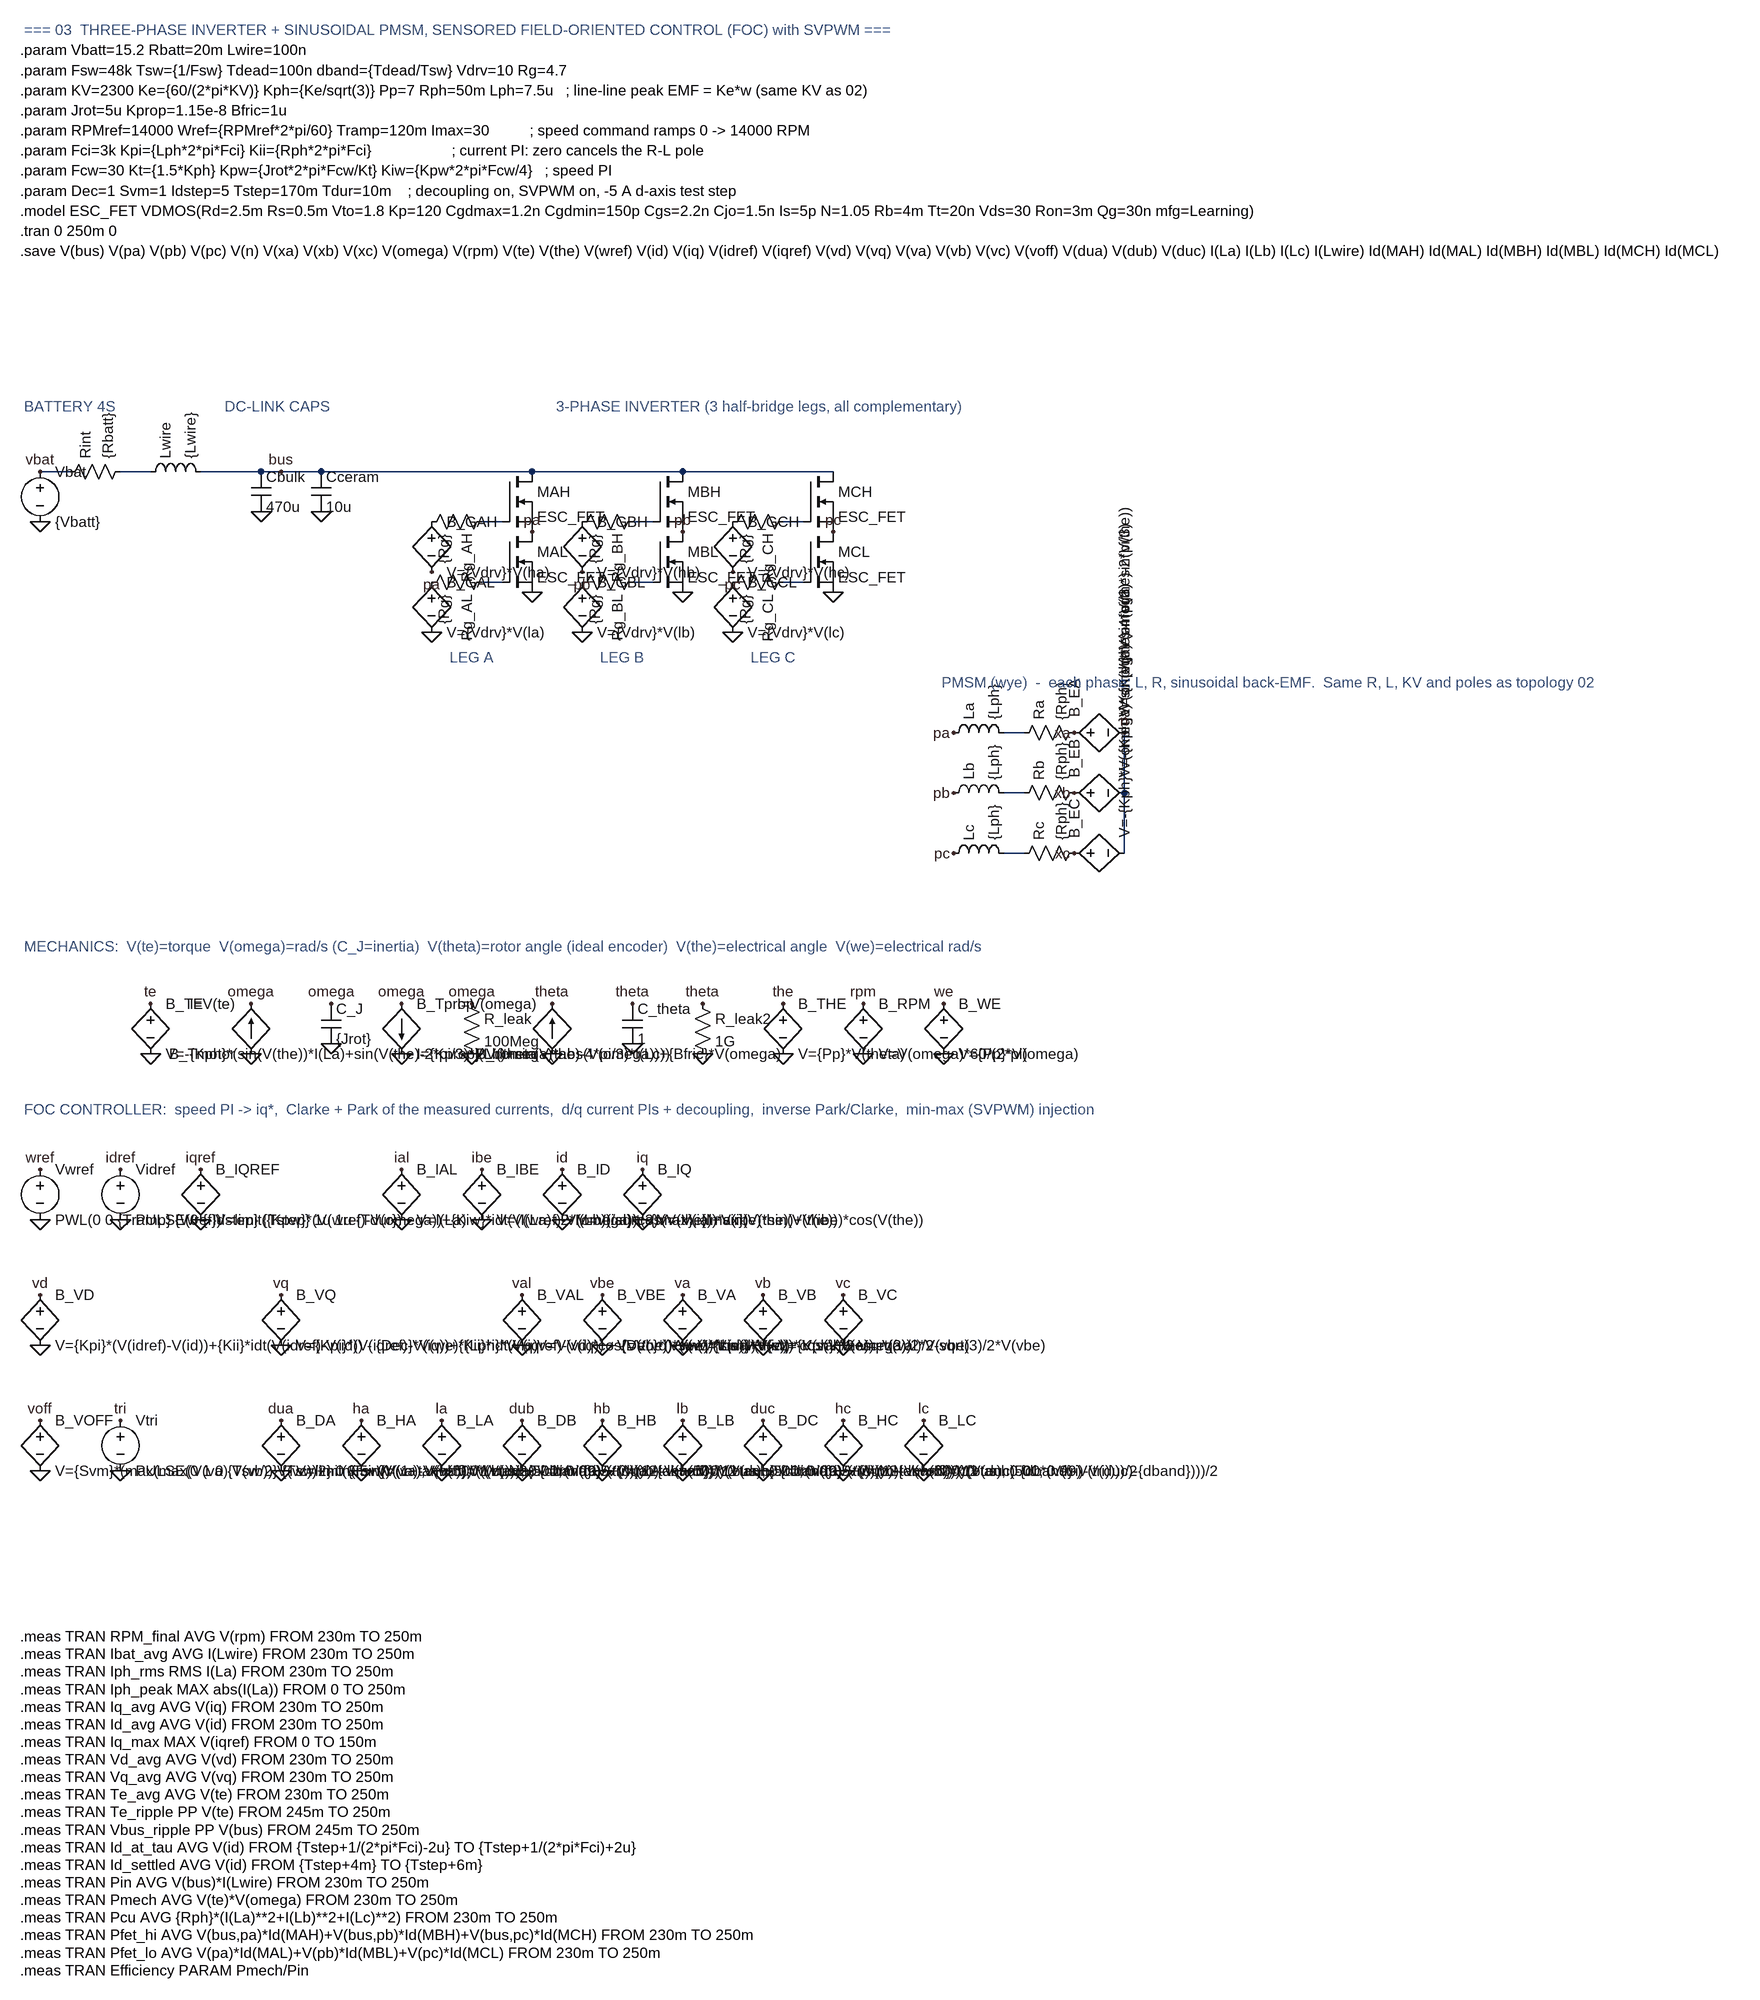
[diagram p0: schematic ThreePhase_FOC.asc]
ThreePhase_FOC.asc, the LTspice schematic file:
Version 4
SHEET 1 2600 2200
SYMBOL voltage 64 128 R0
SYMATTR InstName Vbat
SYMATTR Value {Vbatt}
FLAG 64 224 0
FLAG 64 144 vbat
SYMBOL res 96 160 R270
SYMATTR InstName Rint
SYMATTR Value {Rbatt}
WIRE 64 144 112 144
SYMBOL ind 224 160 R270
SYMATTR InstName Lwire
SYMATTR Value {Lwire}
SYMATTR SpiceLine Rser=2m
WIRE 192 144 240 144
SYMBOL cap 400 144 R0
SYMATTR InstName Cbulk
SYMATTR Value 470u
SYMATTR SpiceLine Rser=30m Lser=10n
FLAG 416 208 0
SYMBOL cap 496 144 R0
SYMATTR InstName Cceram
SYMATTR Value 10u
SYMATTR SpiceLine Rser=2m
FLAG 512 208 0
WIRE 320 144 1328 144
FLAG 448 144 bus
SYMBOL nmos 800 144 R0
SYMATTR InstName MAH
SYMATTR Value ESC_FET
SYMBOL nmos 800 240 R0
SYMATTR InstName MAL
SYMATTR Value ESC_FET
FLAG 848 336 0
FLAG 848 240 pa
SYMBOL res 784 208 R90
SYMATTR InstName Rg_AH
SYMATTR Value {Rg}
WIRE 768 224 800 224
SYMBOL res 784 304 R90
SYMATTR InstName Rg_AL
SYMATTR Value {Rg}
WIRE 768 320 800 320
SYMBOL bv 688 208 R0
SYMATTR InstName B_GAH
SYMATTR Value V={Vdrv}*V(ha)
FLAG 688 304 pa
SYMBOL bv 688 304 R0
SYMATTR InstName B_GAL
SYMATTR Value V={Vdrv}*V(la)
FLAG 688 400 0
TEXT 704 440 Left 2 ;  LEG A
SYMBOL nmos 1040 144 R0
SYMATTR InstName MBH
SYMATTR Value ESC_FET
SYMBOL nmos 1040 240 R0
SYMATTR InstName MBL
SYMATTR Value ESC_FET
FLAG 1088 336 0
FLAG 1088 240 pb
SYMBOL res 1024 208 R90
SYMATTR InstName Rg_BH
SYMATTR Value {Rg}
WIRE 1008 224 1040 224
SYMBOL res 1024 304 R90
SYMATTR InstName Rg_BL
SYMATTR Value {Rg}
WIRE 1008 320 1040 320
SYMBOL bv 928 208 R0
SYMATTR InstName B_GBH
SYMATTR Value V={Vdrv}*V(hb)
FLAG 928 304 pb
SYMBOL bv 928 304 R0
SYMATTR InstName B_GBL
SYMATTR Value V={Vdrv}*V(lb)
FLAG 928 400 0
TEXT 944 440 Left 2 ;  LEG B
SYMBOL nmos 1280 144 R0
SYMATTR InstName MCH
SYMATTR Value ESC_FET
SYMBOL nmos 1280 240 R0
SYMATTR InstName MCL
SYMATTR Value ESC_FET
FLAG 1328 336 0
FLAG 1328 240 pc
SYMBOL res 1264 208 R90
SYMATTR InstName Rg_CH
SYMATTR Value {Rg}
WIRE 1248 224 1280 224
SYMBOL res 1264 304 R90
SYMATTR InstName Rg_CL
SYMATTR Value {Rg}
WIRE 1248 320 1280 320
SYMBOL bv 1168 208 R0
SYMATTR InstName B_GCH
SYMATTR Value V={Vdrv}*V(hc)
FLAG 1168 304 pc
SYMBOL bv 1168 304 R0
SYMATTR InstName B_GCL
SYMATTR Value V={Vdrv}*V(lc)
FLAG 1168 400 0
TEXT 1184 440 Left 2 ;  LEG C
FLAG 1520 560 pa
SYMBOL ind 1504 576 R270
SYMATTR InstName La
SYMATTR Value {Lph}
SYMBOL res 1616 576 R270
SYMATTR InstName Ra
SYMATTR Value {Rph}
WIRE 1600 560 1632 560
FLAG 1712 560 xa
SYMBOL bv 1696 560 R270
SYMATTR InstName B_EA
SYMATTR Value V=-{Kph}*V(omega)*sin(V(the))
FLAG 1520 656 pb
SYMBOL ind 1504 672 R270
SYMATTR InstName Lb
SYMATTR Value {Lph}
SYMBOL res 1616 672 R270
SYMATTR InstName Rb
SYMATTR Value {Rph}
WIRE 1600 656 1632 656
FLAG 1712 656 xb
SYMBOL bv 1696 656 R270
SYMATTR InstName B_EB
SYMATTR Value V=-{Kph}*V(omega)*sin(V(the)-2*pi/3)
FLAG 1520 752 pc
SYMBOL ind 1504 768 R270
SYMATTR InstName Lc
SYMATTR Value {Lph}
SYMBOL res 1616 768 R270
SYMATTR InstName Rc
SYMATTR Value {Rph}
WIRE 1600 752 1632 752
FLAG 1712 752 xc
SYMBOL bv 1696 752 R270
SYMATTR InstName B_EC
SYMATTR Value V=-{Kph}*V(omega)*sin(V(the)-4*pi/3)
WIRE 1792 560 1792 752
FLAG 1792 560 n
TEXT 1488 480 Left 2 ;  PMSM (wye)  -  each phase: L, R, sinusoidal back-EMF.  Same R, L, KV and poles as topology 02
SYMBOL bv 240 976 R0
SYMATTR InstName B_TE
SYMATTR Value V=-{Kph}*(sin(V(the))*I(La)+sin(V(the)-2*pi/3)*I(Lb)+sin(V(the)-4*pi/3)*I(Lc))
FLAG 240 992 te
FLAG 240 1072 0
SYMBOL bi 400 1072 R180
SYMATTR InstName B_Tmotor
SYMATTR Value I=V(te)
FLAG 400 1072 0
FLAG 400 992 omega
SYMBOL cap 512 992 R0
SYMATTR InstName C_J
SYMATTR Value {Jrot}
FLAG 528 992 omega
FLAG 528 1056 0
SYMBOL bi 640 992 R0
SYMATTR InstName B_Tprop
SYMATTR Value I={Kprop}*V(omega)*abs(V(omega))+{Bfric}*V(omega)
FLAG 640 992 omega
FLAG 640 1072 0
SYMBOL res 736 976 R0
SYMATTR InstName R_leak
SYMATTR Value 100Meg
FLAG 752 992 omega
FLAG 752 1072 0
SYMBOL bi 880 1072 R180
SYMATTR InstName B_dtheta
SYMATTR Value I=V(omega)
FLAG 880 1072 0
FLAG 880 992 theta
SYMBOL cap 992 992 R0
SYMATTR InstName C_theta
SYMATTR Value 1
FLAG 1008 992 theta
FLAG 1008 1056 0
SYMBOL res 1104 976 R0
SYMATTR InstName R_leak2
SYMATTR Value 1G
FLAG 1120 992 theta
FLAG 1120 1072 0
SYMBOL bv 1248 976 R0
SYMATTR InstName B_THE
SYMATTR Value V={Pp}*V(theta)
FLAG 1248 992 the
FLAG 1248 1072 0
SYMBOL bv 1376 976 R0
SYMATTR InstName B_RPM
SYMATTR Value V=V(omega)*60/(2*pi)
FLAG 1376 992 rpm
FLAG 1376 1072 0
SYMBOL bv 1504 976 R0
SYMATTR InstName B_WE
SYMATTR Value V={Pp}*V(omega)
FLAG 1504 992 we
FLAG 1504 1072 0
TEXT 32 900 Left 2 ; MECHANICS:  V(te)=torque  V(omega)=rad/s (C_J=inertia)  V(theta)=rotor angle (ideal encoder)  V(the)=electrical angle  V(we)=electrical rad/s
TEXT 32 1160 Left 2 ; FOC CONTROLLER:  speed PI -> iq*,  Clarke + Park of the measured currents,  d/q current PIs + decoupling,  inverse Park/Clarke,  min-max (SVPWM) injection
SYMBOL voltage 64 1240 R0
SYMATTR InstName Vwref
SYMATTR Value PWL(0 0 {Tramp} {Wref})
FLAG 64 1256 wref
FLAG 64 1336 0
SYMBOL voltage 192 1240 R0
SYMATTR InstName Vidref
SYMATTR Value PULSE(0 {-Idstep} {Tstep} 1u 1u {Tdur})
FLAG 192 1256 idref
FLAG 192 1336 0
SYMBOL bv 320 1240 R0
SYMATTR InstName B_IQREF
SYMATTR Value V=limit({Kpw}*(V(wref)-V(omega))+{Kiw}*idt(V(wref)-V(omega)), -{Imax}, {Imax})
FLAG 320 1256 iqref
FLAG 320 1336 0
SYMBOL bv 640 1240 R0
SYMATTR InstName B_IAL
SYMATTR Value V=I(La)
FLAG 640 1256 ial
FLAG 640 1336 0
SYMBOL bv 768 1240 R0
SYMATTR InstName B_IBE
SYMATTR Value V=(I(La)+2*I(Lb))/sqrt(3)
FLAG 768 1256 ibe
FLAG 768 1336 0
SYMBOL bv 896 1240 R0
SYMATTR InstName B_ID
SYMATTR Value V=V(ial)*cos(V(the))+V(ibe)*sin(V(the))
FLAG 896 1256 id
FLAG 896 1336 0
SYMBOL bv 1024 1240 R0
SYMATTR InstName B_IQ
SYMATTR Value V=-V(ial)*sin(V(the))+V(ibe)*cos(V(the))
FLAG 1024 1256 iq
FLAG 1024 1336 0
SYMBOL bv 64 1440 R0
SYMATTR InstName B_VD
SYMATTR Value V={Kpi}*(V(idref)-V(id))+{Kii}*idt(V(idref)-V(id)) - {Dec}*V(we)*{Lph}*V(iq)
FLAG 64 1456 vd
FLAG 64 1536 0
SYMBOL bv 448 1440 R0
SYMATTR InstName B_VQ
SYMATTR Value V={Kpi}*(V(iqref)-V(iq))+{Kii}*idt(V(iqref)-V(iq)) + {Dec}*(V(we)*{Lph}*V(id)+{Kph}*V(omega))
FLAG 448 1456 vq
FLAG 448 1536 0
SYMBOL bv 832 1440 R0
SYMATTR InstName B_VAL
SYMATTR Value V=V(vd)*cos(V(the))-V(vq)*sin(V(the))
FLAG 832 1456 val
FLAG 832 1536 0
SYMBOL bv 960 1440 R0
SYMATTR InstName B_VBE
SYMATTR Value V=V(vd)*sin(V(the))+V(vq)*cos(V(the))
FLAG 960 1456 vbe
FLAG 960 1536 0
SYMBOL bv 1088 1440 R0
SYMATTR InstName B_VA
SYMATTR Value V=V(val)
FLAG 1088 1456 va
FLAG 1088 1536 0
SYMBOL bv 1216 1440 R0
SYMATTR InstName B_VB
SYMATTR Value V=-V(val)/2+sqrt(3)/2*V(vbe)
FLAG 1216 1456 vb
FLAG 1216 1536 0
SYMBOL bv 1344 1440 R0
SYMATTR InstName B_VC
SYMATTR Value V=-V(val)/2-sqrt(3)/2*V(vbe)
FLAG 1344 1456 vc
FLAG 1344 1536 0
SYMBOL bv 64 1640 R0
SYMATTR InstName B_VOFF
SYMATTR Value V={Svm}*(max(max(V(va),V(vb)),V(vc))+min(min(V(va),V(vb)),V(vc)))/2
FLAG 64 1656 voff
FLAG 64 1736 0
SYMBOL voltage 192 1640 R0
SYMATTR InstName Vtri
SYMATTR Value PULSE(0 1 0 {Tsw/2} {Tsw/2} 0 {Tsw})
FLAG 192 1656 tri
FLAG 192 1736 0
SYMBOL bv 448 1640 R0
SYMATTR InstName B_DA
SYMATTR Value V=limit(0.5+(V(va)-V(voff))/V(bus), 0.01, 0.99)
FLAG 448 1656 dua
FLAG 448 1736 0
SYMBOL bv 576 1640 R0
SYMATTR InstName B_HA
SYMATTR Value V=(1+tanh(500*(V(dua)-{dband}-V(tri))))/2
FLAG 576 1656 ha
FLAG 576 1736 0
SYMBOL bv 704 1640 R0
SYMATTR InstName B_LA
SYMATTR Value V=(1+tanh(500*(V(tri)-V(dua)-{dband})))/2
FLAG 704 1656 la
FLAG 704 1736 0
SYMBOL bv 832 1640 R0
SYMATTR InstName B_DB
SYMATTR Value V=limit(0.5+(V(vb)-V(voff))/V(bus), 0.01, 0.99)
FLAG 832 1656 dub
FLAG 832 1736 0
SYMBOL bv 960 1640 R0
SYMATTR InstName B_HB
SYMATTR Value V=(1+tanh(500*(V(dub)-{dband}-V(tri))))/2
FLAG 960 1656 hb
FLAG 960 1736 0
SYMBOL bv 1088 1640 R0
SYMATTR InstName B_LB
SYMATTR Value V=(1+tanh(500*(V(tri)-V(dub)-{dband})))/2
FLAG 1088 1656 lb
FLAG 1088 1736 0
SYMBOL bv 1216 1640 R0
SYMATTR InstName B_DC
SYMATTR Value V=limit(0.5+(V(vc)-V(voff))/V(bus), 0.01, 0.99)
FLAG 1216 1656 duc
FLAG 1216 1736 0
SYMBOL bv 1344 1640 R0
SYMATTR InstName B_HC
SYMATTR Value V=(1+tanh(500*(V(duc)-{dband}-V(tri))))/2
FLAG 1344 1656 hc
FLAG 1344 1736 0
SYMBOL bv 1472 1640 R0
SYMATTR InstName B_LC
SYMATTR Value V=(1+tanh(500*(V(tri)-V(duc)-{dband})))/2
FLAG 1472 1656 lc
FLAG 1472 1736 0
TEXT 32 -560 Left 2 ; === 03  THREE-PHASE INVERTER + SINUSOIDAL PMSM, SENSORED FIELD-ORIENTED CONTROL (FOC) with SVPWM ===
TEXT 32 -528 Left 2 !.param Vbatt=15.2 Rbatt=20m Lwire=100n
TEXT 32 -496 Left 2 !.param Fsw=48k Tsw={1/Fsw} Tdead=100n dband={Tdead/Tsw} Vdrv=10 Rg=4.7
TEXT 32 -464 Left 2 !.param KV=2300 Ke={60/(2*pi*KV)} Kph={Ke/sqrt(3)} Pp=7 Rph=50m Lph=7.5u   ; line-line peak EMF = Ke*w (same KV as 02)
TEXT 32 -432 Left 2 !.param Jrot=5u Kprop=1.15e-8 Bfric=1u
TEXT 32 -400 Left 2 !.param RPMref=14000 Wref={RPMref*2*pi/60} Tramp=120m Imax=30          ; speed command ramps 0 -> 14000 RPM
TEXT 32 -368 Left 2 !.param Fci=3k Kpi={Lph*2*pi*Fci} Kii={Rph*2*pi*Fci}                    ; current PI: zero cancels the R-L pole
TEXT 32 -336 Left 2 !.param Fcw=30 Kt={1.5*Kph} Kpw={Jrot*2*pi*Fcw/Kt} Kiw={Kpw*2*pi*Fcw/4}   ; speed PI
TEXT 32 -304 Left 2 !.param Dec=1 Svm=1 Idstep=5 Tstep=170m Tdur=10m    ; decoupling on, SVPWM on, -5 A d-axis test step
TEXT 32 -272 Left 2 !.model ESC_FET VDMOS(Rd=2.5m Rs=0.5m Vto=1.8 Kp=120 Cgdmax=1.2n Cgdmin=150p Cgs=2.2n Cjo=1.5n Is=5p N=1.05 Rb=4m Tt=20n Vds=30 Ron=3m Qg=30n mfg=Learning)
TEXT 32 -240 Left 2 !.tran 0 250m 0
TEXT 32 -208 Left 2 !.save V(bus) V(pa) V(pb) V(pc) V(n) V(xa) V(xb) V(xc) V(omega) V(rpm) V(te) V(the) V(wref) V(id) V(iq) V(idref) V(iqref) V(vd) V(vq) V(va) V(vb) V(vc) V(voff) V(dua) V(dub) V(duc) I(La) I(Lb) I(Lc) I(Lwire) Id(MAH) Id(MAL) Id(MBH) Id(MBL) Id(MCH) Id(MCL)
TEXT 32 2000 Left 2 !.meas TRAN RPM_final AVG V(rpm) FROM 230m TO 250m
TEXT 32 2028 Left 2 !.meas TRAN Ibat_avg AVG I(Lwire) FROM 230m TO 250m
TEXT 32 2056 Left 2 !.meas TRAN Iph_rms RMS I(La) FROM 230m TO 250m
TEXT 32 2084 Left 2 !.meas TRAN Iph_peak MAX abs(I(La)) FROM 0 TO 250m
TEXT 32 2112 Left 2 !.meas TRAN Iq_avg AVG V(iq) FROM 230m TO 250m
TEXT 32 2140 Left 2 !.meas TRAN Id_avg AVG V(id) FROM 230m TO 250m
TEXT 32 2168 Left 2 !.meas TRAN Iq_max MAX V(iqref) FROM 0 TO 150m
TEXT 32 2196 Left 2 !.meas TRAN Vd_avg AVG V(vd) FROM 230m TO 250m
TEXT 32 2224 Left 2 !.meas TRAN Vq_avg AVG V(vq) FROM 230m TO 250m
TEXT 32 2252 Left 2 !.meas TRAN Te_avg AVG V(te) FROM 230m TO 250m
TEXT 32 2280 Left 2 !.meas TRAN Te_ripple PP V(te) FROM 245m TO 250m
TEXT 32 2308 Left 2 !.meas TRAN Vbus_ripple PP V(bus) FROM 245m TO 250m
TEXT 32 2336 Left 2 !.meas TRAN Id_at_tau AVG V(id) FROM {Tstep+1/(2*pi*Fci)-2u} TO {Tstep+1/(2*pi*Fci)+2u}
TEXT 32 2364 Left 2 !.meas TRAN Id_settled AVG V(id) FROM {Tstep+4m} TO {Tstep+6m}
TEXT 32 2392 Left 2 !.meas TRAN Pin AVG V(bus)*I(Lwire) FROM 230m TO 250m
TEXT 32 2420 Left 2 !.meas TRAN Pmech AVG V(te)*V(omega) FROM 230m TO 250m
TEXT 32 2448 Left 2 !.meas TRAN Pcu AVG {Rph}*(I(La)**2+I(Lb)**2+I(Lc)**2) FROM 230m TO 250m
TEXT 32 2476 Left 2 !.meas TRAN Pfet_hi AVG V(bus,pa)*Id(MAH)+V(bus,pb)*Id(MBH)+V(bus,pc)*Id(MCH) FROM 230m TO 250m
TEXT 32 2504 Left 2 !.meas TRAN Pfet_lo AVG V(pa)*Id(MAL)+V(pb)*Id(MBL)+V(pc)*Id(MCL) FROM 230m TO 250m
TEXT 32 2532 Left 2 !.meas TRAN Efficiency PARAM Pmech/Pin
TEXT 32 40 Left 2 ; BATTERY 4S
TEXT 352 40 Left 2 ; DC-LINK CAPS
TEXT 880 40 Left 2 ; 3-PHASE INVERTER (3 half-bridge legs, all complementary)

The netlist it stands for:
* ThreePhase_FOC.asc
Vbat vbat 0 {Vbatt}
Rint vbat N001 {Rbatt}
Lwire N001 bus {Lwire} Rser=2m
Cbulk bus 0 470u Rser=30m Lser=10n
Cceram bus 0 10u Rser=2m
MAH bus N002 pa pa ESC_FET
MAL pa N003 0 0 ESC_FET
Rg_AH N002 P001 {Rg}
Rg_AL N003 P002 {Rg}
B_GAH P001 pa V={Vdrv}*V(ha)
B_GAL P002 0 V={Vdrv}*V(la)
MBH bus N004 pb pb ESC_FET
MBL pb N005 0 0 ESC_FET
Rg_BH N004 P003 {Rg}
Rg_BL N005 P004 {Rg}
B_GBH P003 pb V={Vdrv}*V(hb)
B_GBL P004 0 V={Vdrv}*V(lb)
MCH bus N006 pc pc ESC_FET
MCL pc N007 0 0 ESC_FET
Rg_CH N006 P005 {Rg}
Rg_CL N007 P006 {Rg}
B_GCH P005 pc V={Vdrv}*V(hc)
B_GCL P006 0 V={Vdrv}*V(lc)
La pa N008 {Lph}
Ra N008 xa {Rph}
B_EA xa n V=-{Kph}*V(omega)*sin(V(the))
Lb pb N009 {Lph}
Rb N009 xb {Rph}
B_EB xb n V=-{Kph}*V(omega)*sin(V(the)-2*pi/3)
Lc pc N010 {Lph}
Rc N010 xc {Rph}
B_EC xc n V=-{Kph}*V(omega)*sin(V(the)-4*pi/3)
B_TE te 0 V=-{Kph}*(sin(V(the))*I(La)+sin(V(the)-2*pi/3)*I(Lb)+sin(V(the)-4*pi/3)*I(Lc))
B_Tmotor 0 omega I=V(te)
C_J omega 0 {Jrot}
B_Tprop omega 0 I={Kprop}*V(omega)*abs(V(omega))+{Bfric}*V(omega)
R_leak omega 0 100Meg
B_dtheta 0 theta I=V(omega)
C_theta theta 0 1
R_leak2 theta 0 1G
B_THE the 0 V={Pp}*V(theta)
B_RPM rpm 0 V=V(omega)*60/(2*pi)
B_WE we 0 V={Pp}*V(omega)
Vwref wref 0 PWL(0 0 {Tramp} {Wref})
Vidref idref 0 PULSE(0 {-Idstep} {Tstep} 1u 1u {Tdur})
B_IQREF iqref 0 V=limit({Kpw}*(V(wref)-V(omega))+{Kiw}*idt(V(wref)-V(omega)), -{Imax}, {Imax})
B_IAL ial 0 V=I(La)
B_IBE ibe 0 V=(I(La)+2*I(Lb))/sqrt(3)
B_ID id 0 V=V(ial)*cos(V(the))+V(ibe)*sin(V(the))
B_IQ iq 0 V=-V(ial)*sin(V(the))+V(ibe)*cos(V(the))
B_VD vd 0 V={Kpi}*(V(idref)-V(id))+{Kii}*idt(V(idref)-V(id)) - {Dec}*V(we)*{Lph}*V(iq)
B_VQ vq 0 V={Kpi}*(V(iqref)-V(iq))+{Kii}*idt(V(iqref)-V(iq)) + {Dec}*(V(we)*{Lph}*V(id)+{Kph}*V(omega))
B_VAL val 0 V=V(vd)*cos(V(the))-V(vq)*sin(V(the))
B_VBE vbe 0 V=V(vd)*sin(V(the))+V(vq)*cos(V(the))
B_VA va 0 V=V(val)
B_VB vb 0 V=-V(val)/2+sqrt(3)/2*V(vbe)
B_VC vc 0 V=-V(val)/2-sqrt(3)/2*V(vbe)
B_VOFF voff 0 V={Svm}*(max(max(V(va),V(vb)),V(vc))+min(min(V(va),V(vb)),V(vc)))/2
Vtri tri 0 PULSE(0 1 0 {Tsw/2} {Tsw/2} 0 {Tsw})
B_DA dua 0 V=limit(0.5+(V(va)-V(voff))/V(bus), 0.01, 0.99)
B_HA ha 0 V=(1+tanh(500*(V(dua)-{dband}-V(tri))))/2
B_LA la 0 V=(1+tanh(500*(V(tri)-V(dua)-{dband})))/2
B_DB dub 0 V=limit(0.5+(V(vb)-V(voff))/V(bus), 0.01, 0.99)
B_HB hb 0 V=(1+tanh(500*(V(dub)-{dband}-V(tri))))/2
B_LB lb 0 V=(1+tanh(500*(V(tri)-V(dub)-{dband})))/2
B_DC duc 0 V=limit(0.5+(V(vc)-V(voff))/V(bus), 0.01, 0.99)
B_HC hc 0 V=(1+tanh(500*(V(duc)-{dband}-V(tri))))/2
B_LC lc 0 V=(1+tanh(500*(V(tri)-V(duc)-{dband})))/2
.model NMOS NMOS
.model PMOS PMOS
.lib standard.mos
*   LEG A
*   LEG B
*   LEG C
*   PMSM (wye)  -  each phase: L, R, sinusoidal back-EMF.  Same R, L, KV and poles as topology 02
*  MECHANICS:  V(te)=torque  V(omega)=rad/s (C_J=inertia)  V(theta)=rotor angle (ideal encoder)  V(the)=electrical angle  V(we)=electrical rad/s
*  FOC CONTROLLER:  speed PI -> iq*,  Clarke + Park of the measured currents,  d/q current PIs + decoupling,  inverse Park/Clarke,  min-max (SVPWM) injection
*  === 03  THREE-PHASE INVERTER + SINUSOIDAL PMSM, SENSORED FIELD-ORIENTED CONTROL (FOC) with SVPWM ===
.param Vbatt=15.2 Rbatt=20m Lwire=100n
.param Fsw=48k Tsw={1/Fsw} Tdead=100n dband={Tdead/Tsw} Vdrv=10 Rg=4.7
.param KV=2300 Ke={60/(2*pi*KV)} Kph={Ke/sqrt(3)} Pp=7 Rph=50m Lph=7.5u   ; line-line peak EMF = Ke*w (same KV as 02)
.param Jrot=5u Kprop=1.15e-8 Bfric=1u
.param RPMref=14000 Wref={RPMref*2*pi/60} Tramp=120m Imax=30          ; speed command ramps 0 -> 14000 RPM
.param Fci=3k Kpi={Lph*2*pi*Fci} Kii={Rph*2*pi*Fci}                    ; current PI: zero cancels the R-L pole
.param Fcw=30 Kt={1.5*Kph} Kpw={Jrot*2*pi*Fcw/Kt} Kiw={Kpw*2*pi*Fcw/4}   ; speed PI
.param Dec=1 Svm=1 Idstep=5 Tstep=170m Tdur=10m    ; decoupling on, SVPWM on, -5 A d-axis test step
.model ESC_FET VDMOS(Rd=2.5m Rs=0.5m Vto=1.8 Kp=120 Cgdmax=1.2n Cgdmin=150p Cgs=2.2n Cjo=1.5n Is=5p N=1.05 Rb=4m Tt=20n Vds=30 Ron=3m Qg=30n mfg=Learning)
.tran 0 250m 0
.save V(bus) V(pa) V(pb) V(pc) V(n) V(xa) V(xb) V(xc) V(omega) V(rpm) V(te) V(the) V(wref) V(id) V(iq) V(idref) V(iqref) V(vd) V(vq) V(va) V(vb) V(vc) V(voff) V(dua) V(dub) V(duc) I(La) I(Lb) I(Lc) I(Lwire) Id(MAH) Id(MAL) Id(MBH) Id(MBL) Id(MCH) Id(MCL)
.meas TRAN RPM_final AVG V(rpm) FROM 230m TO 250m
.meas TRAN Ibat_avg AVG I(Lwire) FROM 230m TO 250m
.meas TRAN Iph_rms RMS I(La) FROM 230m TO 250m
.meas TRAN Iph_peak MAX abs(I(La)) FROM 0 TO 250m
.meas TRAN Iq_avg AVG V(iq) FROM 230m TO 250m
.meas TRAN Id_avg AVG V(id) FROM 230m TO 250m
.meas TRAN Iq_max MAX V(iqref) FROM 0 TO 150m
.meas TRAN Vd_avg AVG V(vd) FROM 230m TO 250m
.meas TRAN Vq_avg AVG V(vq) FROM 230m TO 250m
.meas TRAN Te_avg AVG V(te) FROM 230m TO 250m
.meas TRAN Te_ripple PP V(te) FROM 245m TO 250m
.meas TRAN Vbus_ripple PP V(bus) FROM 245m TO 250m
.meas TRAN Id_at_tau AVG V(id) FROM {Tstep+1/(2*pi*Fci)-2u} TO {Tstep+1/(2*pi*Fci)+2u}
.meas TRAN Id_settled AVG V(id) FROM {Tstep+4m} TO {Tstep+6m}
.meas TRAN Pin AVG V(bus)*I(Lwire) FROM 230m TO 250m
.meas TRAN Pmech AVG V(te)*V(omega) FROM 230m TO 250m
.meas TRAN Pcu AVG {Rph}*(I(La)**2+I(Lb)**2+I(Lc)**2) FROM 230m TO 250m
.meas TRAN Pfet_hi AVG V(bus,pa)*Id(MAH)+V(bus,pb)*Id(MBH)+V(bus,pc)*Id(MCH) FROM 230m TO 250m
.meas TRAN Pfet_lo AVG V(pa)*Id(MAL)+V(pb)*Id(MBL)+V(pc)*Id(MCL) FROM 230m TO 250m
.meas TRAN Efficiency PARAM Pmech/Pin
*  BATTERY 4S
*  DC-LINK CAPS
*  3-PHASE INVERTER (3 half-bridge legs, all complementary)
.backanno
.end